# Altium schematic sheet ADP32F036QN56Q_EVM_Rev1.1.SchDoc
size A3
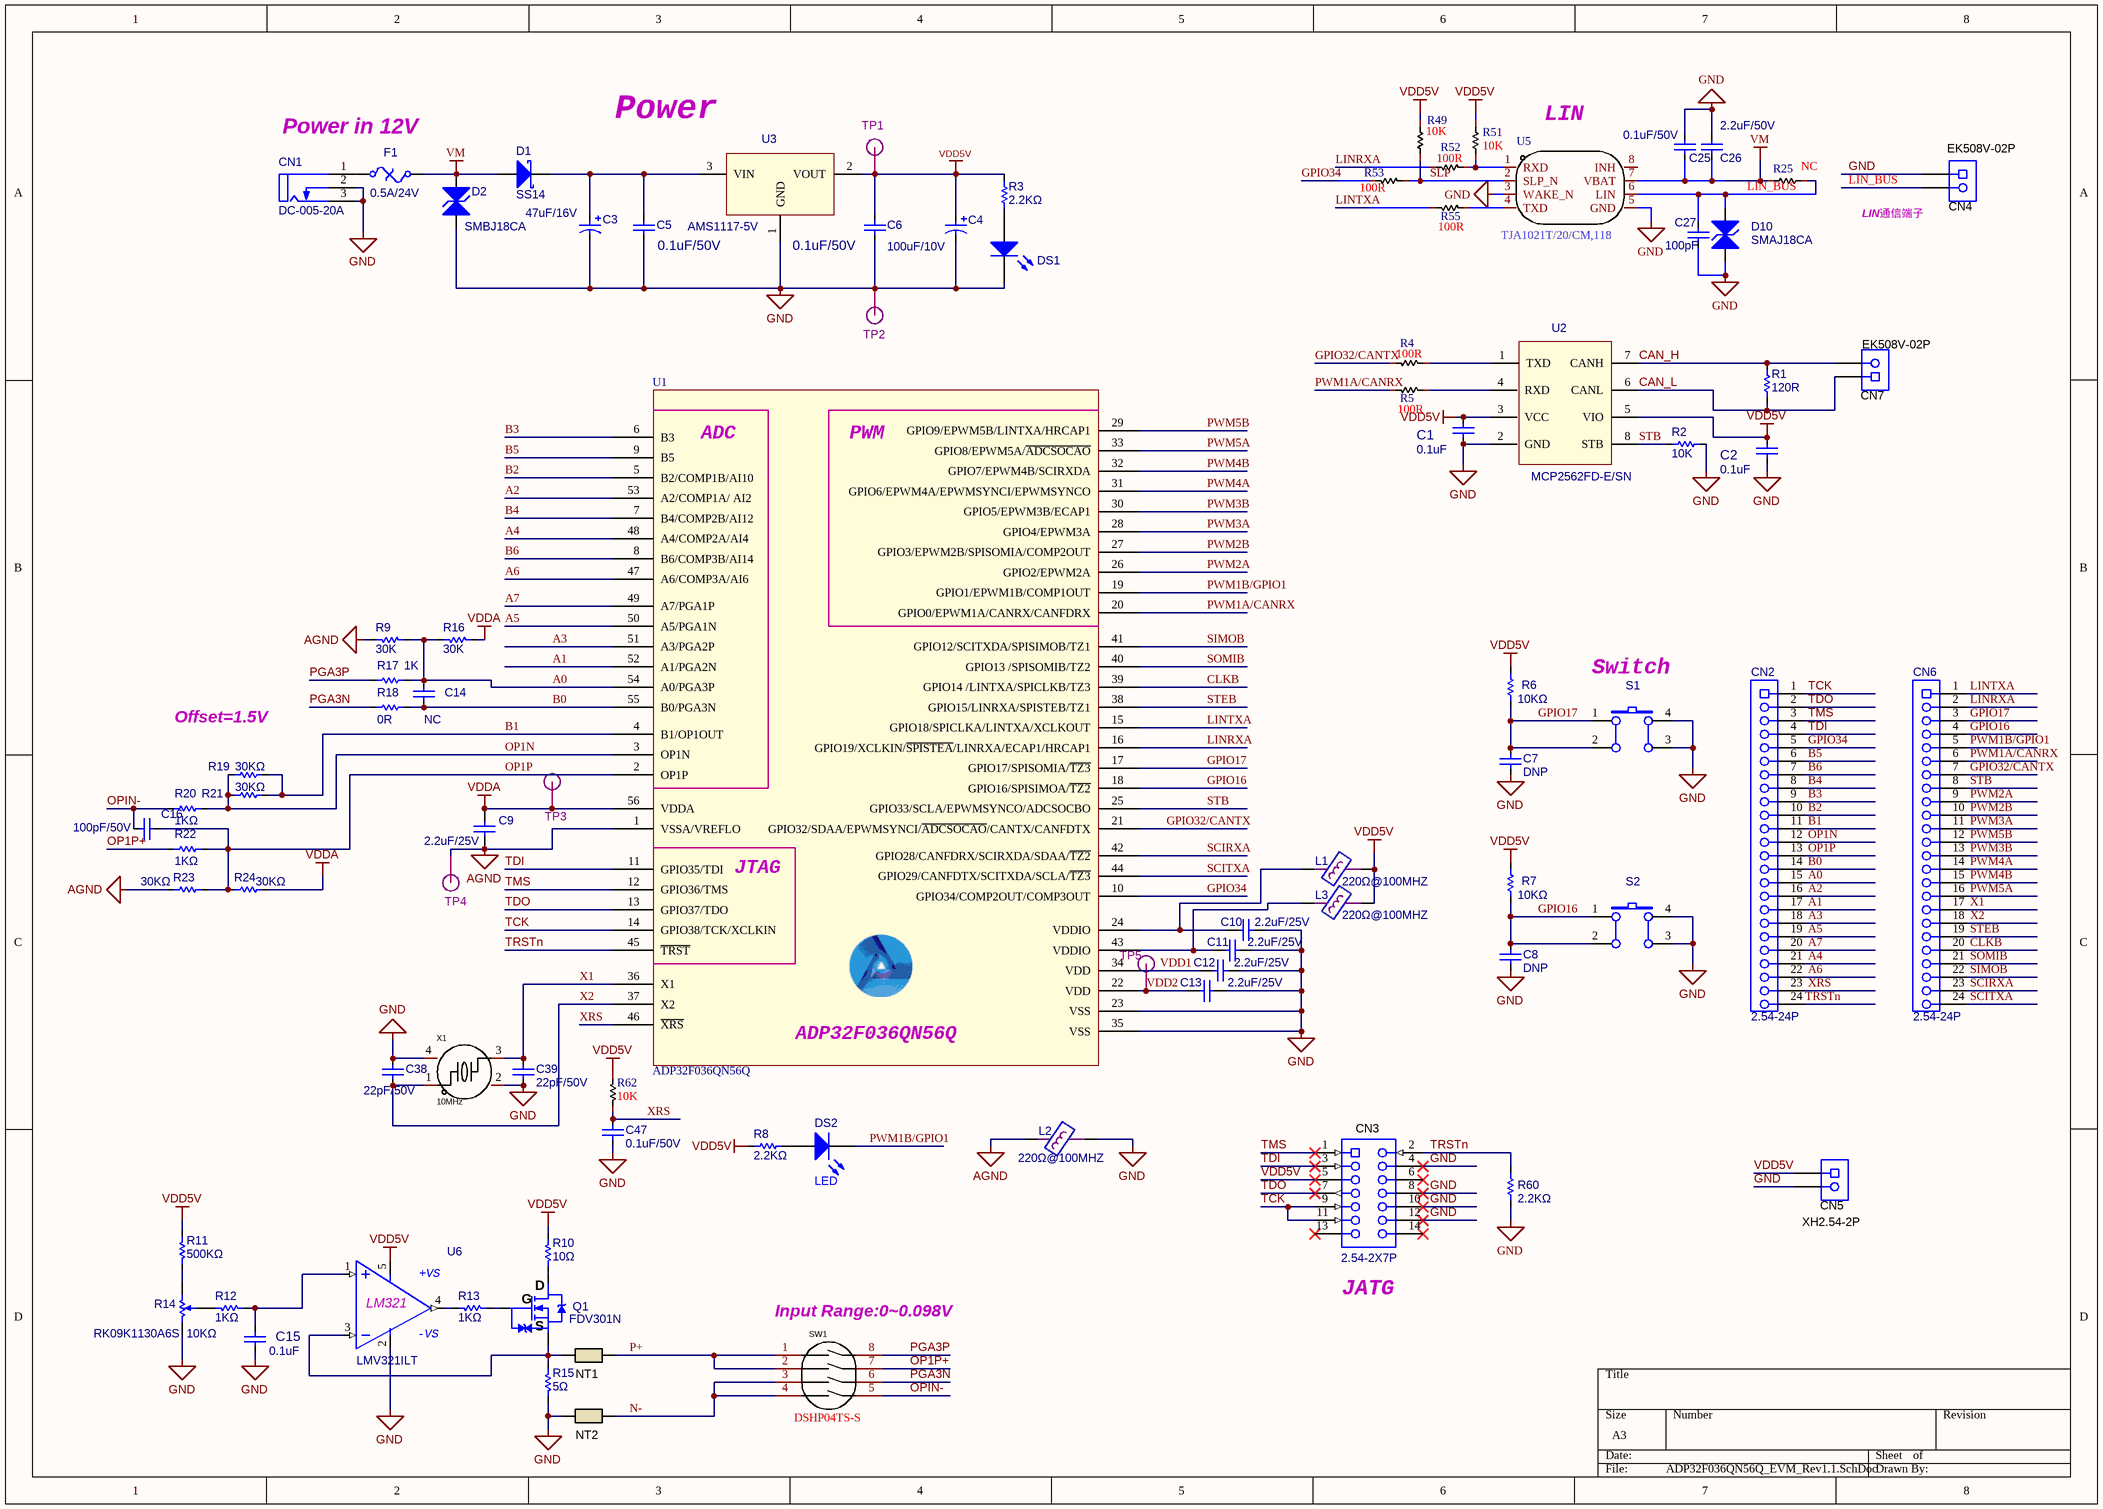
[diagram p0: ADP32F036QN56Q_EVM_Rev1.1.SchDoc]

## Parts
C1  value 0.1uF  [C0603]  (hidden comment: 0.1uF/50V)
C2  value 0.1uF  [C0603]  (hidden comment: 0.1uF/50V)
C3  47uF/16V  [CASE-B_3528]
C4  100uF/10V  [CASE-B_3528]
C5  0.1uF/50V  [C0603]
C6  0.1uF/50V  [C0603]
C7  DNP  [C0603]
C8  DNP  [C0603]
C9  2.2uF/25V  [C0603]
C10  2.2uF/25V  [C0603]
C11  2.2uF/25V  [C0603]
C12  2.2uF/25V  [C0603]
C13  2.2uF/25V  [C0603]
C14  NC  [C0603]
C15  value 0.1uF  [C0603]  (hidden comment: 0.1uF/50V)
C16  100pF/50V  [C0603]
C25  0.1uF/50V  [C0603]
C26  2.2uF/50V  [C0603]
C27  100pF  [C0603]
C38  22pF/50V  [C0603]
C39  22pF/50V  [C0603]
C47  0.1uF/50V  [C0603]
CN1  DC-005-20A  [DC-005]
CN2  2.54-24P  [SIP24A]
CN3  2.54-2X7P  [IDC14-L]
CN4  EK508V-02P  [J-EK508V-02P]
CN5  XH2.54-2P  [sip2_1]
CN6  2.54-24P  [SIP24A]
CN7  EK508V-02P  [J-EK508V-02P]
D1  SS14  [SMA]
D2  SMBJ18CA  [SMB2]
D10  SMAJ18CA  [SMA]
DS1  绿色LED  [SMD_LED0805_LED]  (value not drawn)
DS2  LED  [SMD_LED0805_LED]
F1  0.5A/24V  [1812_PTC_NP]
L1  value 220Ω@100MHZ  [L-0805]  (hidden comment: BLM21PG221SN)
L2  value 220Ω@100MHZ  [L-0805]  (hidden comment: BLM21PG221SN)
L3  value 220Ω@100MHZ  [L-0805]  (hidden comment: BLM21PG221SN)
NT1  Net-Tie  [Net-Tie_10mil]  (value not drawn)  (net tie, no BOM)
NT2  Net-Tie  [Net-Tie_10mil]  (value not drawn)  (net tie, no BOM)
Q1  FDV301N  [MOS-SOT23]
R1  120R  [1206RX]
R2  10K  [R0603]
R3  2.2KΩ  [R0603]
R4  100R  [R0603]
R5  100R  [R0603]
R6  10KΩ  [R0603]
R7  10KΩ  [R0603]
R8  2.2KΩ  [R0603]
R9  30K  [R0603]
R10  10Ω  [1206RX]
R11  500KΩ  [R0603]
R12  1KΩ  [R0603]
R13  1KΩ  [R0603]
R14  RK09K1130A6S  10KΩ  [RK09K1130]
R15  5Ω  [1206RX]
R16  30K  [R0603]
R17  1K  [R0603]
R18  0R  [R0603]
R19  30KΩ  [R0603]
R20  1KΩ  [R0603]
R21  30KΩ  [R0603]
R22  1KΩ  [R0603]
R23  30KΩ  [R0603]
R24  30KΩ  [R0603]
R25  NC  [R0603]
R49  10K  [R0603]
R51  10K  [R0603]
R52  100R  [R0603]
R53  100R  [R0603]
R55  100R  [R0603]
R60  2.2KΩ  [R0603]
R62  10K  [R0603]
S1  6x6x5  [sw-pb10]  (value not drawn)
S2  6x6x5  [sw-pb10]  (value not drawn)
SW1  DSHP04TS-S  [SW-SMD_8P-L6.7-W5.4-P1.27-LS8.5]
TP1  3V3  [Keystone5002]  (value not drawn)
TP2  GND  [Keystone5002]  (value not drawn)
TP3  GND  [Keystone5002]  (value not drawn)
TP4  GND  [Keystone5002]  (value not drawn)
TP5  GND  [Keystone5002]  (value not drawn)
U1  ADP32F036QN56Q  [QFN56-7X7-04P]
U2  MCP2562FD-E/SN  [SO-8]
U3  AMS1117-5V  [SOT-223]
U5  TJA1021T/20/CM,118  [SO-8]
U6  LMV321ILT  [SOT-25]
X1  10MHz  [XTAL_3225]

## Nets
AGND: C9.2 L2.1 R9.1 R23.1 TP4.1 U1.1(VSSA/VREFLO)
GND: C1.2 C2.2 C3.2 C4.2 C5.2 C6.2 C7.1 C8.1 C10.2 C11.2 C12.2 C13.2 C15.2 C25.2 C26.2 C27.2 C38.1 C39.1 C47.1 CN1.2 CN1.3 CN3.4 CN3.8 CN3.10 CN3.12 CN4.1 CN5.2 D2.1(A) D10.1(A) DS1.2(K) L2.2 NT2.1 R2.1 R14.1 R15.1 R60.1 S1.3 S1.4 S2.3 S2.4 TP2.1 U1.23(VSS) U1.35(VSS) U2.2(GND) U3.1(GND) U5.3(WAKE_N) U5.5(GND) U6.2 X1.2(GND) X1.4(GND)
VDD5V: C1.1 C2.1 C4.1 C6.1 CN3.5 CN5.1 L1.2 L3.2 R3.2 R6.1 R7.1 R8.1 R10.2 R11.2 R49.1 R51.1 R62.1 TP1.1 U2.3(VCC) U2.5(VIO) U3.2(VOUT) U6.5
VDDA: C9.1 R16.2 R24.2 TP3.1 U1.56(VDDA)
VM: C25.1 C26.1 D1.1 D2.2(K) F1.2 R25.1 U5.7(VBAT)
A0: C14.1 CN2.15 R9.2 R16.1 R17.1 U1.54(A0/PGA3P)
A1: CN2.17 U1.52(A1/PGA2N)
A2: CN2.16 U1.53(A2/COMP1A/_AI2)
A3: CN2.18 U1.51(A3/PGA2P)
A4: CN2.21 U1.48(A4/COMP2A/AI4)
A5: CN2.19 U1.50(A5/PGA1N)
A6: CN2.22 U1.47(A6/COMP3A/AI6)
A7: CN2.20 U1.49(A7/PGA1P)
B0: C14.2 CN2.14 R18.1 U1.55(B0/PGA3N)
B1: CN2.11 R19.2 R21.1 U1.4(B1/OP1OUT)
B2: CN2.10 U1.5(B2/COMP1B/AI10)
B3: CN2.9 U1.6(B3)
B4: CN2.8 U1.7(B4/COMP2B/AI12)
B5: CN2.6 U1.9(B5)
B6: CN2.7 U1.8(B6/COMP3B/AI14)
CAN_H: CN7.2 R1.2 U2.7(CANH)
CAN_L: CN7.1 R1.1 U2.6(CANL)
CLKB: CN6.20 U1.39(GPIO14_/LINTXA/SPICLKB/TZ3)
GPIO16: C8.2 CN6.4 R7.2 S2.1 S2.2 U1.18(GPIO16/SPISIMOA/~{TZ2})
GPIO17: C7.2 CN6.3 R6.2 S1.1 S1.2 U1.17(GPIO17/SPISOMIA/~{TZ3})
GPIO32/CANTX: CN6.7 R4.1 U1.21(GPIO32/SDAA/EPWMSYNCI/~{ADCSOCAO}/CANTX/CANFDTX)
GPIO34: CN2.5 R53.2 U1.10(GPIO34/COMP2OUT/COMP3OUT)
LIN_BUS: C27.1 CN4.2 D10.2(K) R25.2 U5.6(LIN)
LINRXA: CN6.2 R52.1 U1.16(GPIO19/XCLKIN/~{SPISTEA}/LINRXA/ECAP1/HRCAP1)
LINTXA: CN6.1 R55.1 U1.15(GPIO18/SPICLKA/LINTXA/XCLKOUT)
N-: NT2.2 SW1.3 SW1.4
OP1N: CN2.12 R19.1 R20.2 R21.2 U1.3(OP1N)
OP1P: C16.2 CN2.13 R22.2 R23.2 R24.1 U1.2(OP1P)
OP1P+: R22.1 SW1.7
OPIN-: C16.1 R20.1 SW1.5
P+: NT1.2 SW1.1 SW1.2
PGA3N: R18.2 SW1.6
PGA3P: R17.2 SW1.8
PWM1A/CANRX: CN6.6 R5.1 U1.20(GPIO0/EPWM1A/CANRX/CANFDRX)
PWM1B/GPIO1: CN6.5 DS2.2(K) U1.19(GPIO1/EPWM1B/COMP1OUT)
PWM2A: CN6.9 U1.26(GPIO2/EPWM2A)
PWM2B: CN6.10 U1.27(GPIO3/EPWM2B/SPISOMIA/COMP2OUT)
PWM3A: CN6.11 U1.28(GPIO4/EPWM3A)
PWM3B: CN6.13 U1.30(GPIO5/EPWM3B/ECAP1)
PWM4A: CN6.14 U1.31(GPIO6/EPWM4A/EPWMSYNCI/EPWMSYNCO)
PWM4B: CN6.15 U1.32(GPIO7/EPWM4B/SCIRXDA)
PWM5A: CN6.16 U1.33(GPIO8/EPWM5A/~{ADCSOCAO})
PWM5B: CN6.12 U1.29(GPIO9/EPWM5B/LINTXA/HRCAP1)
SCIRXA: CN6.23 U1.42(GPIO28/CANFDRX/SCIRXDA/SDAA/~{TZ2})
SCITXA: CN6.24 U1.44(GPIO29/CANFDTX/SCITXDA/SCLA/~{TZ3})
SIMOB: CN6.22 U1.41(GPIO12/SCITXDA/SPISIMOB/TZ1)
SLP: R49.2 R53.1 U5.2(SLP_N)
SOMIB: CN6.21 U1.40(GPIO13_/SPISOMIB/TZ2)
STB: CN6.8 R2.2 U1.25(GPIO33/SCLA/EPWMSYNCO/ADCSOCBO) U2.8(STB)
STEB: CN6.19 U1.38(GPIO15/LINRXA/SPISTEB/TZ1)
TCK: CN2.1 CN3.9 CN3.11 U1.14(GPIO38/TCK/XCLKIN)
TDI: CN2.4 CN3.3 U1.11(GPIO35/TDI)
TDO: CN2.2 CN3.7 U1.13(GPIO37/TDO)
TMS: CN2.3 CN3.1 U1.12(GPIO36/TMS)
TRSTn: CN2.24 CN3.2 R60.2 U1.45(~{TRST})
VDD1: C12.1 U1.34(VDD)
VDD2: C13.1 TP5.1 U1.22(VDD)
X1: C39.2 CN6.17 U1.36(X1) X1.3
X2: C38.2 CN6.18 U1.37(X2) X1.1
XRS: C47.2 CN2.23 R62.2 U1.46(~{XRS})
NetC3_1: C3.1 C5.1 D1.2 U3.3(VIN)
NetC10_1: C10.1 L1.1 U1.24(VDDIO)
NetC11_1: C11.1 L3.1 U1.43(VDDIO)
NetC15_1: C15.1 R12.2 U6.1
NetCN1_1: CN1.1 F1.1
NetDS1_1: DS1.1(A) R3.1
NetDS2_1: DS2.1(A) R8.2
NetNT1_1: NT1.1 Q1.S R15.2 U6.3
NetQ1_D: Q1.D R10.1
NetQ1_G: Q1.G R13.1
NetR4_2: R4.2 U2.1(TXD)
NetR5_2: R5.2 U2.4(RXD)
NetR11_1: R11.1 R14.3
NetR12_1: R12.1 R14.2
NetR13_2: R13.2 U6.4
NetR51_2: R51.2 R52.2 U5.1(RXD)
NetR55_2: R55.2 U5.4(TXD)

Not connected (* = marked no-connect by the designer): CN3 6* 13* 14*; U5 8(INH)

## Notes on the sheet
- (near U3) Power
- Power in 12V
- (near U5) LIN
- LIN通信端子
- Offset=1.5V
- (near S1) Switch
- (near SW1) Input Range:0~0.098V
- (near CN3) JATG
- (in symbol ADP32F036QN56Q) ADC; PWM; JTAG
- (in symbol LM321) +VS; -VS

## Library data of the parts
C1 C2 C7 C8 C14-C16 = Cap: 贴片电容; Published: 8-Jun-2000; LatestRevisionDate: 17-Jul-2002; LatestRevisionNote: Re-released for DXP Platform.; Publisher: Altium Limited
C3 C4 = CAP2: 钽电容; Brand Name: 三星; Tolerance error: 10%; cost: ￥0.01
C5 C6 = Cap: 贴片电容; Value: 100pF; Published: 8-Jun-2000; LatestRevisionDate: 17-Jul-2002; LatestRevisionNote: Re-released for DXP Platform.; Publisher: Altium Limited
C9-C13 = C: 贴片电容
C25-C27 C47 = Cap: 贴片电容; Value: TDK C3216X7R1V106KT000E; Published: 8-Jun-2000; LatestRevisionDate: 17-Jul-2002; LatestRevisionNote: Re-released for DXP Platform.; Publisher: Altium Limited
C38 C39 = Cap: COG贴片电容; Value: 100pF; Published: 8-Jun-2000; LatestRevisionDate: 17-Jul-2002; LatestRevisionNote: Re-released for DXP Platform.; Publisher: Altium Limited
CN1 = DC-005: DC电源接口，内径2.1mm; Published: 24-Mar-1999; LatestRevisionDate: 17-Jul-2002; LatestRevisionNote: Re-released for DXP Platform.; Publisher: Altium Limited
CN2 CN6 = CON24A: 连接器
CN3 = Receptacle_7X2: 简易牛角座连接器 卧式; Value: 2.54-2X7P
CN4 CN7 = CON2A: 连接器
CN5 = CON2: 连接器
D1 = D Schottky: 肖特基二极管; Published: 8-Jun-2000; LatestRevisionDate: 17-Jul-2002; LatestRevisionNote: Re-released for DXP Platform.; Publisher: Altium Limited; Code_JEDEC: DO-214-AA
D2 D10 = TVS: TVS二极管; Published: 8-Jun-2000; LatestRevisionDate: 17-Jul-2002; LatestRevisionNote: Re-released for DXP Platform.; Publisher: Altium Limited
DS1 = LED0: 发光二极管; Published: 8-Jun-2000; LatestRevisionDate: 08-Jul-2005; LatestRevisionNote: Mech Layer 1 removed.; PackageReference: LED-0; Publisher: Altium Limited; PackageDescription: LED; 2 Leads
DS2 = LED0: 红色发光二极管; Published: 8-Jun-2000; LatestRevisionDate: 08-Jul-2005; LatestRevisionNote: Mech Layer 1 removed.; PackageReference: LED-0; Publisher: Altium Limited; PackageDescription: LED; 2 Leads
F1 = Fuse Thermal: 自恢复保险丝; Published: 24-Mar-1999; LatestRevisionDate: 17-Jul-2002; LatestRevisionNote: Re-released for DXP Platform.; PackageReference: PIN-W2/E2.8; Publisher: Altium Limited
L1-L3 = FB1: 贴片电感BLM21PG221SN; Code_IEC: 1005; Published: 8-Jun-2000; LatestRevisionDate: 29-May-2009; LatestRevisionNote: IPC-7351 Footprint Added.; PackageReference: 0402-A; Publisher: Altium Limited; PackageDescription: Chip Inductor; Code_JEITA: 0402
NT1 NT2 = CMP-0078142-1: PCB网络短接点; MountType: SMT; PackageReference: N/A; CompType: Net-Tie; Manufacturer: N/A; PartNumber: N/A; Library Reference: Net-Tie
Q1 = 2SK3019: N-MOSFET; Published: 8-Jun-2000; LatestRevisionDate: 17-Jul-2002; LatestRevisionNote: Re-released for DXP Platform.; Publisher: Altium Limited
R1 R17 = Res: 贴片电阻; Published: 8-Jun-2000; LatestRevisionDate: 17-Jul-2002; LatestRevisionNote: Re-released for DXP Platform.; Publisher: Altium Limited
  R17: Value: 1K
R2 R3 R6-R13 R15 R16 R18-R24 R60 = Res: 贴片电阻; Value: 1K; Published: 8-Jun-2000; LatestRevisionDate: 17-Jul-2002; LatestRevisionNote: Re-released for DXP Platform.; Publisher: Altium Limited
R4 R5 R52 R53 R55 = 10K/1%: ------; Name: 1K; Symbol: Res; Add into BOM: yes; Origin Footprint: 0603R-X; Device: 10K/1%; Published: 8-Jun-2000; LatestRevisionDate: 17-Jul-2002; LatestRevisionNote: Re-released for DXP Platform.; Publisher: Altium Limited; Convert to PCB: yes; Design Item ID: Res; Library Name: *
R14 = RPot SM: 立式可调电位器; Published: 17-Dec-2003; DatasheetDocument: Oct-2003; Publisher: Altium Limited
R25 = 10K/1%: ------; Name: 10K; Symbol: Res; Add into BOM: yes; Origin Footprint: 0603R-X; Device: 10K/1%; Published: 8-Jun-2000; LatestRevisionDate: 17-Jul-2002; LatestRevisionNote: Re-released for DXP Platform.; Publisher: Altium Limited; Convert to PCB: yes; Design Item ID: Res; Library Name: *
R49 R51 R62 = 10K/1%: ------; Symbol: Res; Add into BOM: yes; Origin Footprint: 0603R-X; Name: 10K; Device: 10K/1%; Published: 8-Jun-2000; LatestRevisionDate: 17-Jul-2002; LatestRevisionNote: Re-released for DXP Platform.; Publisher: Altium Limited; Convert to PCB: yes; Design Item ID: Res; Library Name: *
S1 S2 = SW6X6X5mm: 贴片轻触开关 6x6x5mm
SW1 = DSHP04TS-S: Add into BOM: yes; Current Rating: 25mA; Voltage Rating: 24V; Number of Positions: 4; Name: DSHP04TS-S; Symbol: DSHP04TS-S; Device: DSHP04TS-S; Supplier Part: C319050; Manufacturer Part: DSHP04TS-S; Supplier Footprint: SMD-8P,5.4x6.7mm; JLCPCB Part Class: Extended Part; Datasheet: https://atta.szlcsc.com/upload/public/pdf/source/20211009/11BE85C99D2C85B0991AF4F9D6EB8BDE.pdf; Supplier: LCSC; Convert to PCB: yes; Lead Pitch: 1.27mm
TP1-TP5 = TP: 测试点
U1 = ADP32F036QN56Q: 进芯32位DSP
U2 = SN65HVD230D: 3.3V CAN FD通讯
U3 = ASM1117-3.3V: 线性稳压器(输入耐压18V)
U5 = TJA1021T/20/CM,118: Add into BOM: yes; Protocol: LINbus; Receiver Hysteresis: 175mV; Supply Voltage: 5.5V ~ 27V; Name: TJA1021T/20/CM,118; Symbol: TJA1021T/20/CM,118; Device: TJA1021T/20/CM,118; LCSC Part Name: TJA1021T/20/CM,118; Supplier Part: C128810; Manufacturer Part: TJA1021T/20/CM,118; Supplier Footprint: SOIC-8; JLCPCB Part Class: Extended Part; Datasheet: https://atta.szlcsc.com/upload/public/pdf/source/20170914/C128810_1505359876382968052.pdf; Supplier: LCSC; Convert to PCB: yes; Operating Temperature: -
U6 = LM321: 运放
X1 = 3TJ410000ZYLBC: 无源晶振; Manufacturer: JYJE(晶友嘉); Add into BOM: yes; Crystal Type: 贴片晶振; Normal temperature Frequency Tolerance: ±10ppm; External load capacitor: 20pF; Frequency Stability(Full temperature range): ±30ppm; Equivalent Series Resistance (ESR): 150Ω; Name: 10MHz; Symbol: 3TJ410000ZYLBC; Device: 3TJ410000ZYLBC; LCSC Part Name: 10MHz ±10ppm 20pF; Supplier Part: C2898998; Manufacturer Part: 3TJ410000ZYLBC; Supplier Footprint: SMD3225-4P; JLCPCB Part Class: Extended Part; Datasheet: https://atta.szlcsc.com/upload/public/pdf/source/20210922/C2898998_79DA4CA19A36528DCEC4420D32E637EE.pdf; Supplier: LCSC; Convert to PCB: yes; Value: 10MHz; Operating Temperature: -40℃~+85℃